# Altium schematic sheet Top_Sheet.SchDoc
size 420 x 297 mm; SheetNumber: 1; SheetTotal: 3
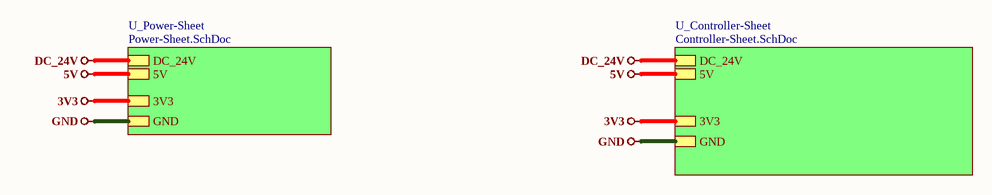
[diagram p0: Top_Sheet.SchDoc]

## Sub-sheets
U_Controller-Sheet = Controller-Sheet.SchDoc: 3V3, GND, 5V, DC_24V
U_Power-Sheet = Power-Sheet.SchDoc: 3V3, 5V, GND, DC_24V

## Nets
3V3: sheet U_Controller-Sheet/3V3, sheet U_Power-Sheet/3V3
5V: sheet U_Controller-Sheet/5V, sheet U_Power-Sheet/5V
DC_24V: sheet U_Controller-Sheet/DC_24V, sheet U_Power-Sheet/DC_24V
GND: sheet U_Controller-Sheet/GND, sheet U_Power-Sheet/GND

## Notes on the sheet
- File:
- Title:
- Date:
- Page
- Num:
- Total:
- Drawn By: Huzaifa Ali